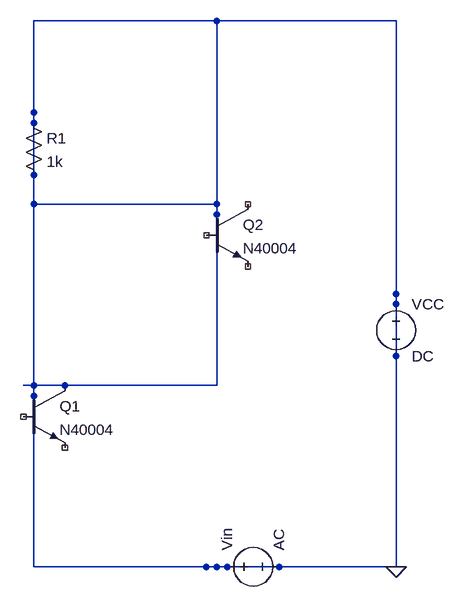
[diagram p0: schematic netlist.asc]
netlist.asc, the LTspice schematic file:
Version 4
SHEET 1 680 480
SYMBOL voltage 816 678 R0
SYMATTR InstName VCC
SYMATTR Value DC
FLAG 816 1098 0
SYMBOL voltage 540 1098 R270
SYMATTR InstName Vin
SYMATTR Value AC
SYMBOL res 242 399 R0
SYMATTR InstName R1
SYMATTR Value 1k
SYMBOL npn 242 819 R0
SYMATTR InstName Q1
SYMATTR Value N40004
SYMBOL npn 524 540 R0
SYMATTR InstName Q2
SYMATTR Value N40004
WIRE 816 1098 816 678
WIRE 524 1098 816 1098
WIRE 258 1098 540 1098
WIRE 258 540 258 399
WIRE 258 819 258 1098
WIRE 258 835 258 540
WIRE 540 819 242 819
WIRE 540 556 540 258
WIRE 540 540 258 540
WIRE 540 540 540 819
WIRE 816 258 816 694
WIRE 816 258 540 258
WIRE 258 258 540 258
WIRE 258 258 258 415

The netlist it stands for:
* netlist.asc
VCC 0 0 DC
Vin 0 0 AC
R1 0 0 1k
* Q1: N40004 (symbol npn not certain, pin order unknown); nets seen at it: 0
Q2 NC_03 NC_04 NC_05 0 N40004
.model NPN NPN
.model PNP PNP
.lib standard.bjt
.backanno
.end